# Altium schematic sheet DSP大板子.SchDoc (part 6 of 7)
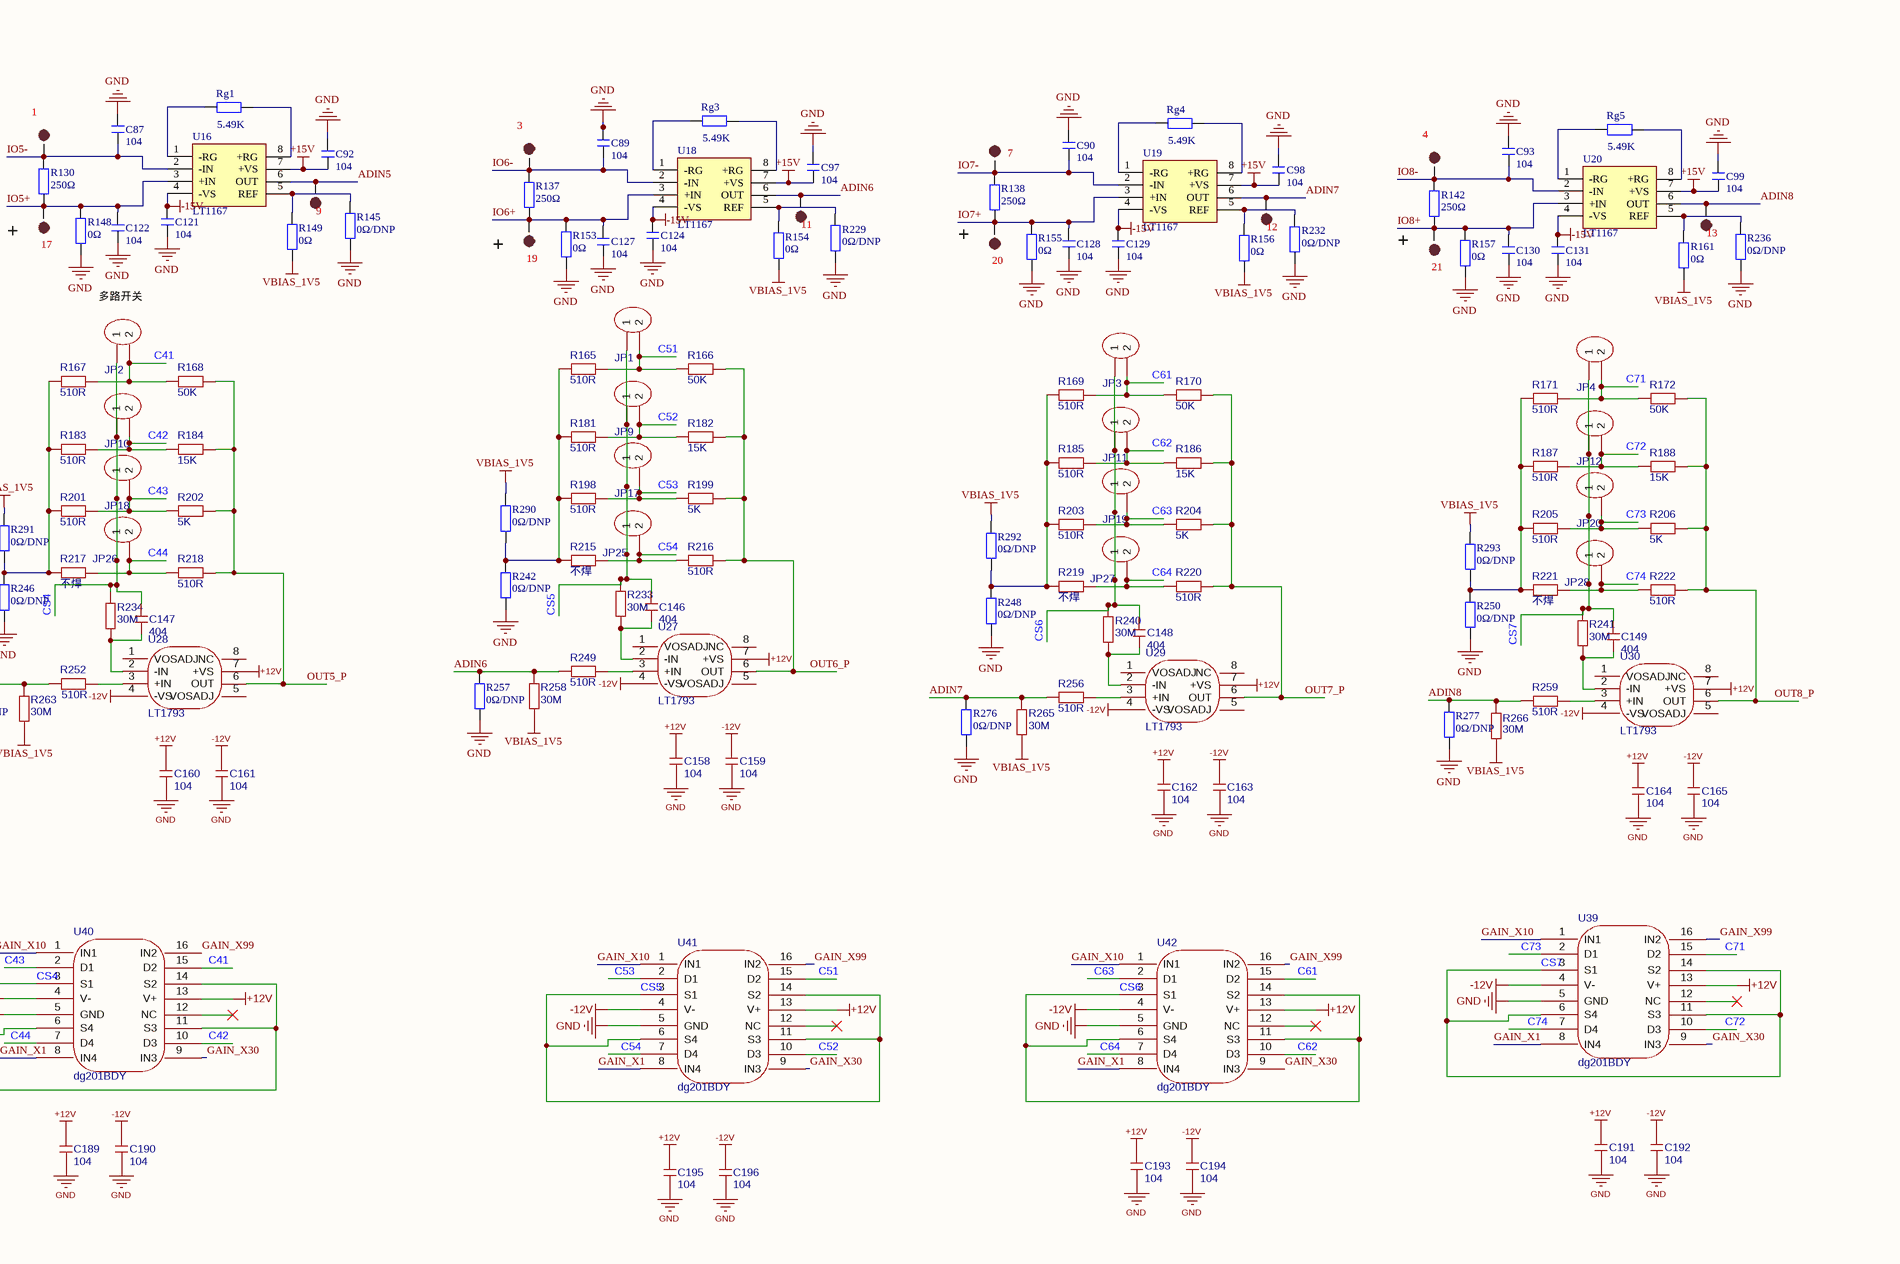
[diagram p108: DSP大板子.SchDoc, bottom right]

## Library data of the parts (continued)
R214 = R: 贴片电阻; 版权归属: 来自淘宝 ID：黄晶宝石; 封装库来自淘宝卖家 ID：黄晶宝石: 其他店铺购入均为盗版，不享受售后技术支持服务，请立即申请退款; Origin Footprint: R 0201_L; OriginFootprint 2: R 0402_L; OriginFootprint 3: R 0805_L; OriginFootprint 4: R 1206_L; OriginFootprint 5: R 1210_L; OriginFootprint 6: R 1812_L; OriginFootprint 7: R 2010_L; OriginFootprint 8: R 2512_L; OriginFootprint 9: R 0201_M; OriginFootprint 10: R 0402_M; OriginFootprint 11: R 0603_M; OriginFootprint 12: R 0805_M; OriginFootprint 13: R 1206_M; OriginFootprint 14: R 1210_M; OriginFootprint 15: R 1812_M; OriginFootprint 16: R 2010_M; OriginFootprint 17: R 2512_M; UniqueId: 6a81be30a454b297; AddInBom: yes; OriginModelName: R 0603; Device: R; BOM名称: 贴片电阻; 联系售后: https://shop463601444.taobao.com; DesignItemID: R; LibraryName: 0.1 - 电阻-电容-电感; SymbolName: R; FootprintName: R 0603_L
R215 = R: 贴片电阻; 版权归属: 来自淘宝 ID：黄晶宝石; 封装库来自淘宝卖家 ID：黄晶宝石: 其他店铺购入均为盗版，不享受售后技术支持服务，请立即申请退款; Origin Footprint: R 0201_L; OriginFootprint 2: R 0402_L; OriginFootprint 3: R 0805_L; OriginFootprint 4: R 1206_L; OriginFootprint 5: R 1210_L; OriginFootprint 6: R 1812_L; OriginFootprint 7: R 2010_L; OriginFootprint 8: R 2512_L; OriginFootprint 9: R 0201_M; OriginFootprint 10: R 0402_M; OriginFootprint 11: R 0603_M; OriginFootprint 12: R 0805_M; OriginFootprint 13: R 1206_M; OriginFootprint 14: R 1210_M; OriginFootprint 15: R 1812_M; OriginFootprint 16: R 2010_M; OriginFootprint 17: R 2512_M; UniqueId: 50053c9146ba4240; AddInBom: yes; OriginModelName: R 0603; Device: R; BOM名称: 贴片电阻; 联系售后: https://shop463601444.taobao.com; DesignItemID: R; LibraryName: 0.1 - 电阻-电容-电感; SymbolName: R; FootprintName: R 0603_L
R216 = R: 贴片电阻; 版权归属: 来自淘宝 ID：黄晶宝石; 封装库来自淘宝卖家 ID：黄晶宝石: 其他店铺购入均为盗版，不享受售后技术支持服务，请立即申请退款; Origin Footprint: R 0201_L; OriginFootprint 2: R 0402_L; OriginFootprint 3: R 0805_L; OriginFootprint 4: R 1206_L; OriginFootprint 5: R 1210_L; OriginFootprint 6: R 1812_L; OriginFootprint 7: R 2010_L; OriginFootprint 8: R 2512_L; OriginFootprint 9: R 0201_M; OriginFootprint 10: R 0402_M; OriginFootprint 11: R 0603_M; OriginFootprint 12: R 0805_M; OriginFootprint 13: R 1206_M; OriginFootprint 14: R 1210_M; OriginFootprint 15: R 1812_M; OriginFootprint 16: R 2010_M; OriginFootprint 17: R 2512_M; UniqueId: 55d3b7675eee0b5f; AddInBom: yes; OriginModelName: R 0603; Device: R; BOM名称: 贴片电阻; 联系售后: https://shop463601444.taobao.com; DesignItemID: R; LibraryName: 0.1 - 电阻-电容-电感; SymbolName: R; FootprintName: R 0603_L
R217 = R: 贴片电阻; 版权归属: 来自淘宝 ID：黄晶宝石; 封装库来自淘宝卖家 ID：黄晶宝石: 其他店铺购入均为盗版，不享受售后技术支持服务，请立即申请退款; Origin Footprint: R 0201_L; OriginFootprint 2: R 0402_L; OriginFootprint 3: R 0805_L; OriginFootprint 4: R 1206_L; OriginFootprint 5: R 1210_L; OriginFootprint 6: R 1812_L; OriginFootprint 7: R 2010_L; OriginFootprint 8: R 2512_L; OriginFootprint 9: R 0201_M; OriginFootprint 10: R 0402_M; OriginFootprint 11: R 0603_M; OriginFootprint 12: R 0805_M; OriginFootprint 13: R 1206_M; OriginFootprint 14: R 1210_M; OriginFootprint 15: R 1812_M; OriginFootprint 16: R 2010_M; OriginFootprint 17: R 2512_M; UniqueId: 356270ea20700a9c; AddInBom: yes; OriginModelName: R 0603; Device: R; BOM名称: 贴片电阻; 联系售后: https://shop463601444.taobao.com; DesignItemID: R; LibraryName: 0.1 - 电阻-电容-电感; SymbolName: R; FootprintName: R 0603_L
R218 = R: 贴片电阻; 版权归属: 来自淘宝 ID：黄晶宝石; 封装库来自淘宝卖家 ID：黄晶宝石: 其他店铺购入均为盗版，不享受售后技术支持服务，请立即申请退款; Origin Footprint: R 0201_L; OriginFootprint 2: R 0402_L; OriginFootprint 3: R 0805_L; OriginFootprint 4: R 1206_L; OriginFootprint 5: R 1210_L; OriginFootprint 6: R 1812_L; OriginFootprint 7: R 2010_L; OriginFootprint 8: R 2512_L; OriginFootprint 9: R 0201_M; OriginFootprint 10: R 0402_M; OriginFootprint 11: R 0603_M; OriginFootprint 12: R 0805_M; OriginFootprint 13: R 1206_M; OriginFootprint 14: R 1210_M; OriginFootprint 15: R 1812_M; OriginFootprint 16: R 2010_M; OriginFootprint 17: R 2512_M; UniqueId: 0bc07fc535f36e79; AddInBom: yes; OriginModelName: R 0603; Device: R; BOM名称: 贴片电阻; 联系售后: https://shop463601444.taobao.com; DesignItemID: R; LibraryName: 0.1 - 电阻-电容-电感; SymbolName: R; FootprintName: R 0603_L
R219 = R: 贴片电阻; 版权归属: 来自淘宝 ID：黄晶宝石; 封装库来自淘宝卖家 ID：黄晶宝石: 其他店铺购入均为盗版，不享受售后技术支持服务，请立即申请退款; Origin Footprint: R 0201_L; OriginFootprint 2: R 0402_L; OriginFootprint 3: R 0805_L; OriginFootprint 4: R 1206_L; OriginFootprint 5: R 1210_L; OriginFootprint 6: R 1812_L; OriginFootprint 7: R 2010_L; OriginFootprint 8: R 2512_L; OriginFootprint 9: R 0201_M; OriginFootprint 10: R 0402_M; OriginFootprint 11: R 0603_M; OriginFootprint 12: R 0805_M; OriginFootprint 13: R 1206_M; OriginFootprint 14: R 1210_M; OriginFootprint 15: R 1812_M; OriginFootprint 16: R 2010_M; OriginFootprint 17: R 2512_M; UniqueId: 4df6a426e202bc68; AddInBom: yes; OriginModelName: R 0603; Device: R; BOM名称: 贴片电阻; 联系售后: https://shop463601444.taobao.com; DesignItemID: R; LibraryName: 0.1 - 电阻-电容-电感; SymbolName: R; FootprintName: R 0603_L
R220 = R: 贴片电阻; 版权归属: 来自淘宝 ID：黄晶宝石; 封装库来自淘宝卖家 ID：黄晶宝石: 其他店铺购入均为盗版，不享受售后技术支持服务，请立即申请退款; Origin Footprint: R 0201_L; OriginFootprint 2: R 0402_L; OriginFootprint 3: R 0805_L; OriginFootprint 4: R 1206_L; OriginFootprint 5: R 1210_L; OriginFootprint 6: R 1812_L; OriginFootprint 7: R 2010_L; OriginFootprint 8: R 2512_L; OriginFootprint 9: R 0201_M; OriginFootprint 10: R 0402_M; OriginFootprint 11: R 0603_M; OriginFootprint 12: R 0805_M; OriginFootprint 13: R 1206_M; OriginFootprint 14: R 1210_M; OriginFootprint 15: R 1812_M; OriginFootprint 16: R 2010_M; OriginFootprint 17: R 2512_M; UniqueId: b62d5738e8aadfe3; AddInBom: yes; OriginModelName: R 0603; Device: R; BOM名称: 贴片电阻; 联系售后: https://shop463601444.taobao.com; DesignItemID: R; LibraryName: 0.1 - 电阻-电容-电感; SymbolName: R; FootprintName: R 0603_L
R221 = R: 贴片电阻; 版权归属: 来自淘宝 ID：黄晶宝石; 封装库来自淘宝卖家 ID：黄晶宝石: 其他店铺购入均为盗版，不享受售后技术支持服务，请立即申请退款; Origin Footprint: R 0201_L; OriginFootprint 2: R 0402_L; OriginFootprint 3: R 0805_L; OriginFootprint 4: R 1206_L; OriginFootprint 5: R 1210_L; OriginFootprint 6: R 1812_L; OriginFootprint 7: R 2010_L; OriginFootprint 8: R 2512_L; OriginFootprint 9: R 0201_M; OriginFootprint 10: R 0402_M; OriginFootprint 11: R 0603_M; OriginFootprint 12: R 0805_M; OriginFootprint 13: R 1206_M; OriginFootprint 14: R 1210_M; OriginFootprint 15: R 1812_M; OriginFootprint 16: R 2010_M; OriginFootprint 17: R 2512_M; UniqueId: f6a722bea999a1f8; AddInBom: yes; OriginModelName: R 0603; Device: R; BOM名称: 贴片电阻; 联系售后: https://shop463601444.taobao.com; DesignItemID: R; LibraryName: 0.1 - 电阻-电容-电感; SymbolName: R; FootprintName: R 0603_L
R222 = R: 贴片电阻; 版权归属: 来自淘宝 ID：黄晶宝石; 封装库来自淘宝卖家 ID：黄晶宝石: 其他店铺购入均为盗版，不享受售后技术支持服务，请立即申请退款; Origin Footprint: R 0201_L; OriginFootprint 2: R 0402_L; OriginFootprint 3: R 0805_L; OriginFootprint 4: R 1206_L; OriginFootprint 5: R 1210_L; OriginFootprint 6: R 1812_L; OriginFootprint 7: R 2010_L; OriginFootprint 8: R 2512_L; OriginFootprint 9: R 0201_M; OriginFootprint 10: R 0402_M; OriginFootprint 11: R 0603_M; OriginFootprint 12: R 0805_M; OriginFootprint 13: R 1206_M; OriginFootprint 14: R 1210_M; OriginFootprint 15: R 1812_M; OriginFootprint 16: R 2010_M; OriginFootprint 17: R 2512_M; UniqueId: 85b67f9d76b2e874; AddInBom: yes; OriginModelName: R 0603; Device: R; BOM名称: 贴片电阻; 联系售后: https://shop463601444.taobao.com; DesignItemID: R; LibraryName: 0.1 - 电阻-电容-电感; SymbolName: R; FootprintName: R 0603_L
R223 = R: 贴片电阻; 版权归属: 来自淘宝 ID：黄晶宝石; 封装库来自淘宝卖家 ID：黄晶宝石: 其他店铺购入均为盗版，不享受售后技术支持服务，请立即申请退款; Origin Footprint: R 0201_L; OriginFootprint 2: R 0402_L; OriginFootprint 3: R 0805_L; OriginFootprint 4: R 1206_L; OriginFootprint 5: R 1210_L; OriginFootprint 6: R 1812_L; OriginFootprint 7: R 2010_L; OriginFootprint 8: R 2512_L; OriginFootprint 9: R 0201_M; OriginFootprint 10: R 0402_M; OriginFootprint 11: R 0603_M; OriginFootprint 12: R 0805_M; OriginFootprint 13: R 1206_M; OriginFootprint 14: R 1210_M; OriginFootprint 15: R 1812_M; OriginFootprint 16: R 2010_M; OriginFootprint 17: R 2512_M; UniqueId: e0ee0f05e2f0b4da; AddInBom: yes; OriginModelName: R 0603; Device: R; BOM名称: 贴片电阻; 联系售后: https://shop463601444.taobao.com; DesignItemID: R; LibraryName: 0.1 - 电阻-电容-电感; SymbolName: R; FootprintName: R 0603_L
R224 = R: 贴片电阻; 版权归属: 来自淘宝 ID：黄晶宝石; 封装库来自淘宝卖家 ID：黄晶宝石: 其他店铺购入均为盗版，不享受售后技术支持服务，请立即申请退款; Origin Footprint: R 0201_L; OriginFootprint 2: R 0402_L; OriginFootprint 3: R 0805_L; OriginFootprint 4: R 1206_L; OriginFootprint 5: R 1210_L; OriginFootprint 6: R 1812_L; OriginFootprint 7: R 2010_L; OriginFootprint 8: R 2512_L; OriginFootprint 9: R 0201_M; OriginFootprint 10: R 0402_M; OriginFootprint 11: R 0603_M; OriginFootprint 12: R 0805_M; OriginFootprint 13: R 1206_M; OriginFootprint 14: R 1210_M; OriginFootprint 15: R 1812_M; OriginFootprint 16: R 2010_M; OriginFootprint 17: R 2512_M; UniqueId: 3fbbebc0b09736fe; AddInBom: yes; OriginModelName: R 0603; Device: R; BOM名称: 贴片电阻; 联系售后: https://shop463601444.taobao.com; DesignItemID: R; LibraryName: 0.1 - 电阻-电容-电感; SymbolName: R; FootprintName: R 0603_L
R225 = R: 贴片电阻; 版权归属: 来自淘宝 ID：黄晶宝石; 封装库来自淘宝卖家 ID：黄晶宝石: 其他店铺购入均为盗版，不享受售后技术支持服务，请立即申请退款; Origin Footprint: R 0201_L; OriginFootprint 2: R 0402_L; OriginFootprint 3: R 0805_L; OriginFootprint 4: R 1206_L; OriginFootprint 5: R 1210_L; OriginFootprint 6: R 1812_L; OriginFootprint 7: R 2010_L; OriginFootprint 8: R 2512_L; OriginFootprint 9: R 0201_M; OriginFootprint 10: R 0402_M; OriginFootprint 11: R 0603_M; OriginFootprint 12: R 0805_M; OriginFootprint 13: R 1206_M; OriginFootprint 14: R 1210_M; OriginFootprint 15: R 1812_M; OriginFootprint 16: R 2010_M; OriginFootprint 17: R 2512_M; UniqueId: 1ad54b734ffff27e; AddInBom: yes; OriginModelName: R 0603; Device: R; BOM名称: 贴片电阻; 联系售后: https://shop463601444.taobao.com; DesignItemID: R; LibraryName: 0.1 - 电阻-电容-电感; SymbolName: R; FootprintName: R 0603_L
R226 = R: 贴片电阻; 版权归属: 来自淘宝 ID：黄晶宝石; 封装库来自淘宝卖家 ID：黄晶宝石: 其他店铺购入均为盗版，不享受售后技术支持服务，请立即申请退款; Origin Footprint: R 0201_L; OriginFootprint 2: R 0402_L; OriginFootprint 3: R 0805_L; OriginFootprint 4: R 1206_L; OriginFootprint 5: R 1210_L; OriginFootprint 6: R 1812_L; OriginFootprint 7: R 2010_L; OriginFootprint 8: R 2512_L; OriginFootprint 9: R 0201_M; OriginFootprint 10: R 0402_M; OriginFootprint 11: R 0603_M; OriginFootprint 12: R 0805_M; OriginFootprint 13: R 1206_M; OriginFootprint 14: R 1210_M; OriginFootprint 15: R 1812_M; OriginFootprint 16: R 2010_M; OriginFootprint 17: R 2512_M; UniqueId: 1733e0132aa39ad1; AddInBom: yes; OriginModelName: R 0603; Device: R; BOM名称: 贴片电阻; 联系售后: https://shop463601444.taobao.com; DesignItemID: R; LibraryName: 0.1 - 电阻-电容-电感; SymbolName: R; FootprintName: R 0603_L
R227 = R: 贴片电阻; 版权归属: 来自淘宝 ID：黄晶宝石; 封装库来自淘宝卖家 ID：黄晶宝石: 其他店铺购入均为盗版，不享受售后技术支持服务，请立即申请退款; Origin Footprint: R 0201_L; OriginFootprint 2: R 0402_L; OriginFootprint 3: R 0805_L; OriginFootprint 4: R 1206_L; OriginFootprint 5: R 1210_L; OriginFootprint 6: R 1812_L; OriginFootprint 7: R 2010_L; OriginFootprint 8: R 2512_L; OriginFootprint 9: R 0201_M; OriginFootprint 10: R 0402_M; OriginFootprint 11: R 0603_M; OriginFootprint 12: R 0805_M; OriginFootprint 13: R 1206_M; OriginFootprint 14: R 1210_M; OriginFootprint 15: R 1812_M; OriginFootprint 16: R 2010_M; OriginFootprint 17: R 2512_M; UniqueId: e174b74f1d9ac547; AddInBom: yes; OriginModelName: R 0603; Device: R; BOM名称: 贴片电阻; 联系售后: https://shop463601444.taobao.com; DesignItemID: R; LibraryName: 0.1 - 电阻-电容-电感; SymbolName: R; FootprintName: R 0603_L
R228 = R: 贴片电阻; 版权归属: 来自淘宝 ID：黄晶宝石; 封装库来自淘宝卖家 ID：黄晶宝石: 其他店铺购入均为盗版，不享受售后技术支持服务，请立即申请退款; Origin Footprint: R 0201_L; OriginFootprint 2: R 0402_L; OriginFootprint 3: R 0805_L; OriginFootprint 4: R 1206_L; OriginFootprint 5: R 1210_L; OriginFootprint 6: R 1812_L; OriginFootprint 7: R 2010_L; OriginFootprint 8: R 2512_L; OriginFootprint 9: R 0201_M; OriginFootprint 10: R 0402_M; OriginFootprint 11: R 0603_M; OriginFootprint 12: R 0805_M; OriginFootprint 13: R 1206_M; OriginFootprint 14: R 1210_M; OriginFootprint 15: R 1812_M; OriginFootprint 16: R 2010_M; OriginFootprint 17: R 2512_M; UniqueId: c6a558d5d37ead57; AddInBom: yes; OriginModelName: R 0603; Device: R; BOM名称: 贴片电阻; 联系售后: https://shop463601444.taobao.com; DesignItemID: R; LibraryName: 0.1 - 电阻-电容-电感; SymbolName: R; FootprintName: R 0603_L
R230 = R: 贴片电阻; 版权归属: 来自淘宝 ID：黄晶宝石; 封装库来自淘宝卖家 ID：黄晶宝石: 其他店铺购入均为盗版，不享受售后技术支持服务，请立即申请退款; Origin Footprint: R 0201_L; OriginFootprint 2: R 0402_L; OriginFootprint 3: R 0805_L; OriginFootprint 4: R 1206_L; OriginFootprint 5: R 1210_L; OriginFootprint 6: R 1812_L; OriginFootprint 7: R 2010_L; OriginFootprint 8: R 2512_L; OriginFootprint 9: R 0201_M; OriginFootprint 10: R 0402_M; OriginFootprint 11: R 0603_M; OriginFootprint 12: R 0805_M; OriginFootprint 13: R 1206_M; OriginFootprint 14: R 1210_M; OriginFootprint 15: R 1812_M; OriginFootprint 16: R 2010_M; OriginFootprint 17: R 2512_M; UniqueId: d9f908b8ca857374; AddInBom: yes; OriginModelName: R 0603; Device: R; BOM名称: 贴片电阻; 联系售后: https://shop463601444.taobao.com; DesignItemID: R; LibraryName: 0.1 - 电阻-电容-电感; SymbolName: R; FootprintName: R 0603_L
R231 = R: 贴片电阻; 版权归属: 来自淘宝 ID：黄晶宝石; 封装库来自淘宝卖家 ID：黄晶宝石: 其他店铺购入均为盗版，不享受售后技术支持服务，请立即申请退款; Origin Footprint: R 0201_L; OriginFootprint 2: R 0402_L; OriginFootprint 3: R 0805_L; OriginFootprint 4: R 1206_L; OriginFootprint 5: R 1210_L; OriginFootprint 6: R 1812_L; OriginFootprint 7: R 2010_L; OriginFootprint 8: R 2512_L; OriginFootprint 9: R 0201_M; OriginFootprint 10: R 0402_M; OriginFootprint 11: R 0603_M; OriginFootprint 12: R 0805_M; OriginFootprint 13: R 1206_M; OriginFootprint 14: R 1210_M; OriginFootprint 15: R 1812_M; OriginFootprint 16: R 2010_M; OriginFootprint 17: R 2512_M; UniqueId: 2aff7b51dc10ad2a; AddInBom: yes; OriginModelName: R 0603; Device: R; BOM名称: 贴片电阻; 联系售后: https://shop463601444.taobao.com; DesignItemID: R; LibraryName: 0.1 - 电阻-电容-电感; SymbolName: R; FootprintName: R 0603_L
R233 = R: 贴片电阻; 版权归属: 来自淘宝 ID：黄晶宝石; 封装库来自淘宝卖家 ID：黄晶宝石: 其他店铺购入均为盗版，不享受售后技术支持服务，请立即申请退款; Origin Footprint: R 0201_L; OriginFootprint 2: R 0402_L; OriginFootprint 3: R 0805_L; OriginFootprint 4: R 1206_L; OriginFootprint 5: R 1210_L; OriginFootprint 6: R 1812_L; OriginFootprint 7: R 2010_L; OriginFootprint 8: R 2512_L; OriginFootprint 9: R 0201_M; OriginFootprint 10: R 0402_M; OriginFootprint 11: R 0603_M; OriginFootprint 12: R 0805_M; OriginFootprint 13: R 1206_M; OriginFootprint 14: R 1210_M; OriginFootprint 15: R 1812_M; OriginFootprint 16: R 2010_M; OriginFootprint 17: R 2512_M; UniqueId: 5dfbcaad1eafe703; AddInBom: yes; OriginModelName: R 0603; Device: R; BOM名称: 贴片电阻; 联系售后: https://shop463601444.taobao.com; DesignItemID: R; LibraryName: 0.1 - 电阻-电容-电感; SymbolName: R; FootprintName: R 0603_L
R234 = R: 贴片电阻; 版权归属: 来自淘宝 ID：黄晶宝石; 封装库来自淘宝卖家 ID：黄晶宝石: 其他店铺购入均为盗版，不享受售后技术支持服务，请立即申请退款; Origin Footprint: R 0201_L; OriginFootprint 2: R 0402_L; OriginFootprint 3: R 0805_L; OriginFootprint 4: R 1206_L; OriginFootprint 5: R 1210_L; OriginFootprint 6: R 1812_L; OriginFootprint 7: R 2010_L; OriginFootprint 8: R 2512_L; OriginFootprint 9: R 0201_M; OriginFootprint 10: R 0402_M; OriginFootprint 11: R 0603_M; OriginFootprint 12: R 0805_M; OriginFootprint 13: R 1206_M; OriginFootprint 14: R 1210_M; OriginFootprint 15: R 1812_M; OriginFootprint 16: R 2010_M; OriginFootprint 17: R 2512_M; UniqueId: bf789344b0fac116; AddInBom: yes; OriginModelName: R 0603; Device: R; BOM名称: 贴片电阻; 联系售后: https://shop463601444.taobao.com; DesignItemID: R; LibraryName: 0.1 - 电阻-电容-电感; SymbolName: R; FootprintName: R 0603_L